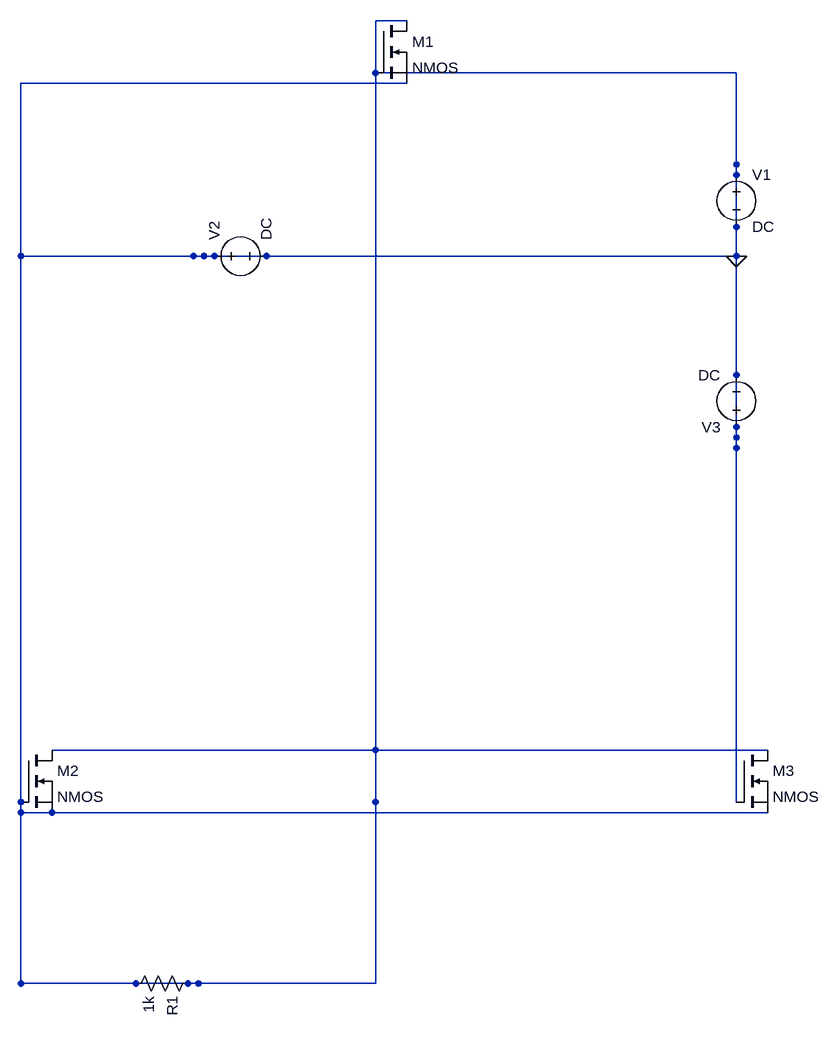
[diagram p0: schematic netlist5.asc]
netlist5.asc, the LTspice schematic file:
Version 4
SHEET 1 680 480
SYMBOL voltage 1599 399 R0
SYMATTR InstName V1
SYMATTR Value DC
FLAG 1599 540 0
SYMBOL voltage 780 540 R270
SYMATTR InstName V2
SYMATTR Value DC
SYMBOL voltage 1599 819 R180
SYMATTR InstName V3
SYMATTR Value DC
SYMBOL nmos 1044 178 R0
SYMATTR InstName M1
SYMATTR Value NMOS
SYMBOL nmos 498 1300 R0
SYMATTR InstName M2
SYMATTR Value NMOS
SYMBOL nmos 1599 1300 R0
SYMATTR InstName M3
SYMATTR Value NMOS
SYMBOL res 771 1643 R90
SYMATTR InstName R1
SYMATTR Value 1k
WIRE 1599 540 1599 399
WIRE 764 540 1599 540
WIRE 498 540 780 540
WIRE 1599 835 1599 540
WIRE 1599 1098 1599 819
WIRE 771 1659 498 1659
WIRE 1599 258 1599 415
WIRE 1599 258 1323 258
WIRE 1044 1659 1044 1380
WIRE 1044 1659 755 1659
WIRE 1092 178 1044 178
WIRE 1044 178 1044 1380
WIRE 1044 258 1323 258
WIRE 1092 274 498 274
WIRE 498 274 498 1659
WIRE 546 1300 1044 1300
WIRE 1044 1300 1044 1380
WIRE 498 1380 498 540
WIRE 546 1396 498 1396
WIRE 498 1396 498 1659
WIRE 1647 1300 1044 1300
WIRE 1044 1300 1044 1380
WIRE 1599 1380 1599 1098
WIRE 1647 1396 498 1396
WIRE 498 1396 498 1659

The netlist it stands for:
* netlist5.asc
V1 0 0 DC
V2 0 0 DC
V3 0 0 DC
M1 0 0 0 0 NMOS
M2 0 0 0 0 NMOS
M3 0 0 0 0 NMOS
R1 0 0 1k
.model NMOS NMOS
.model PMOS PMOS
.lib standard.mos
.backanno
.end